# Altium schematic sheet CC_CV_Down-programmer.SchDoc
size A3; SheetNumber: 4; SheetTotal: 7
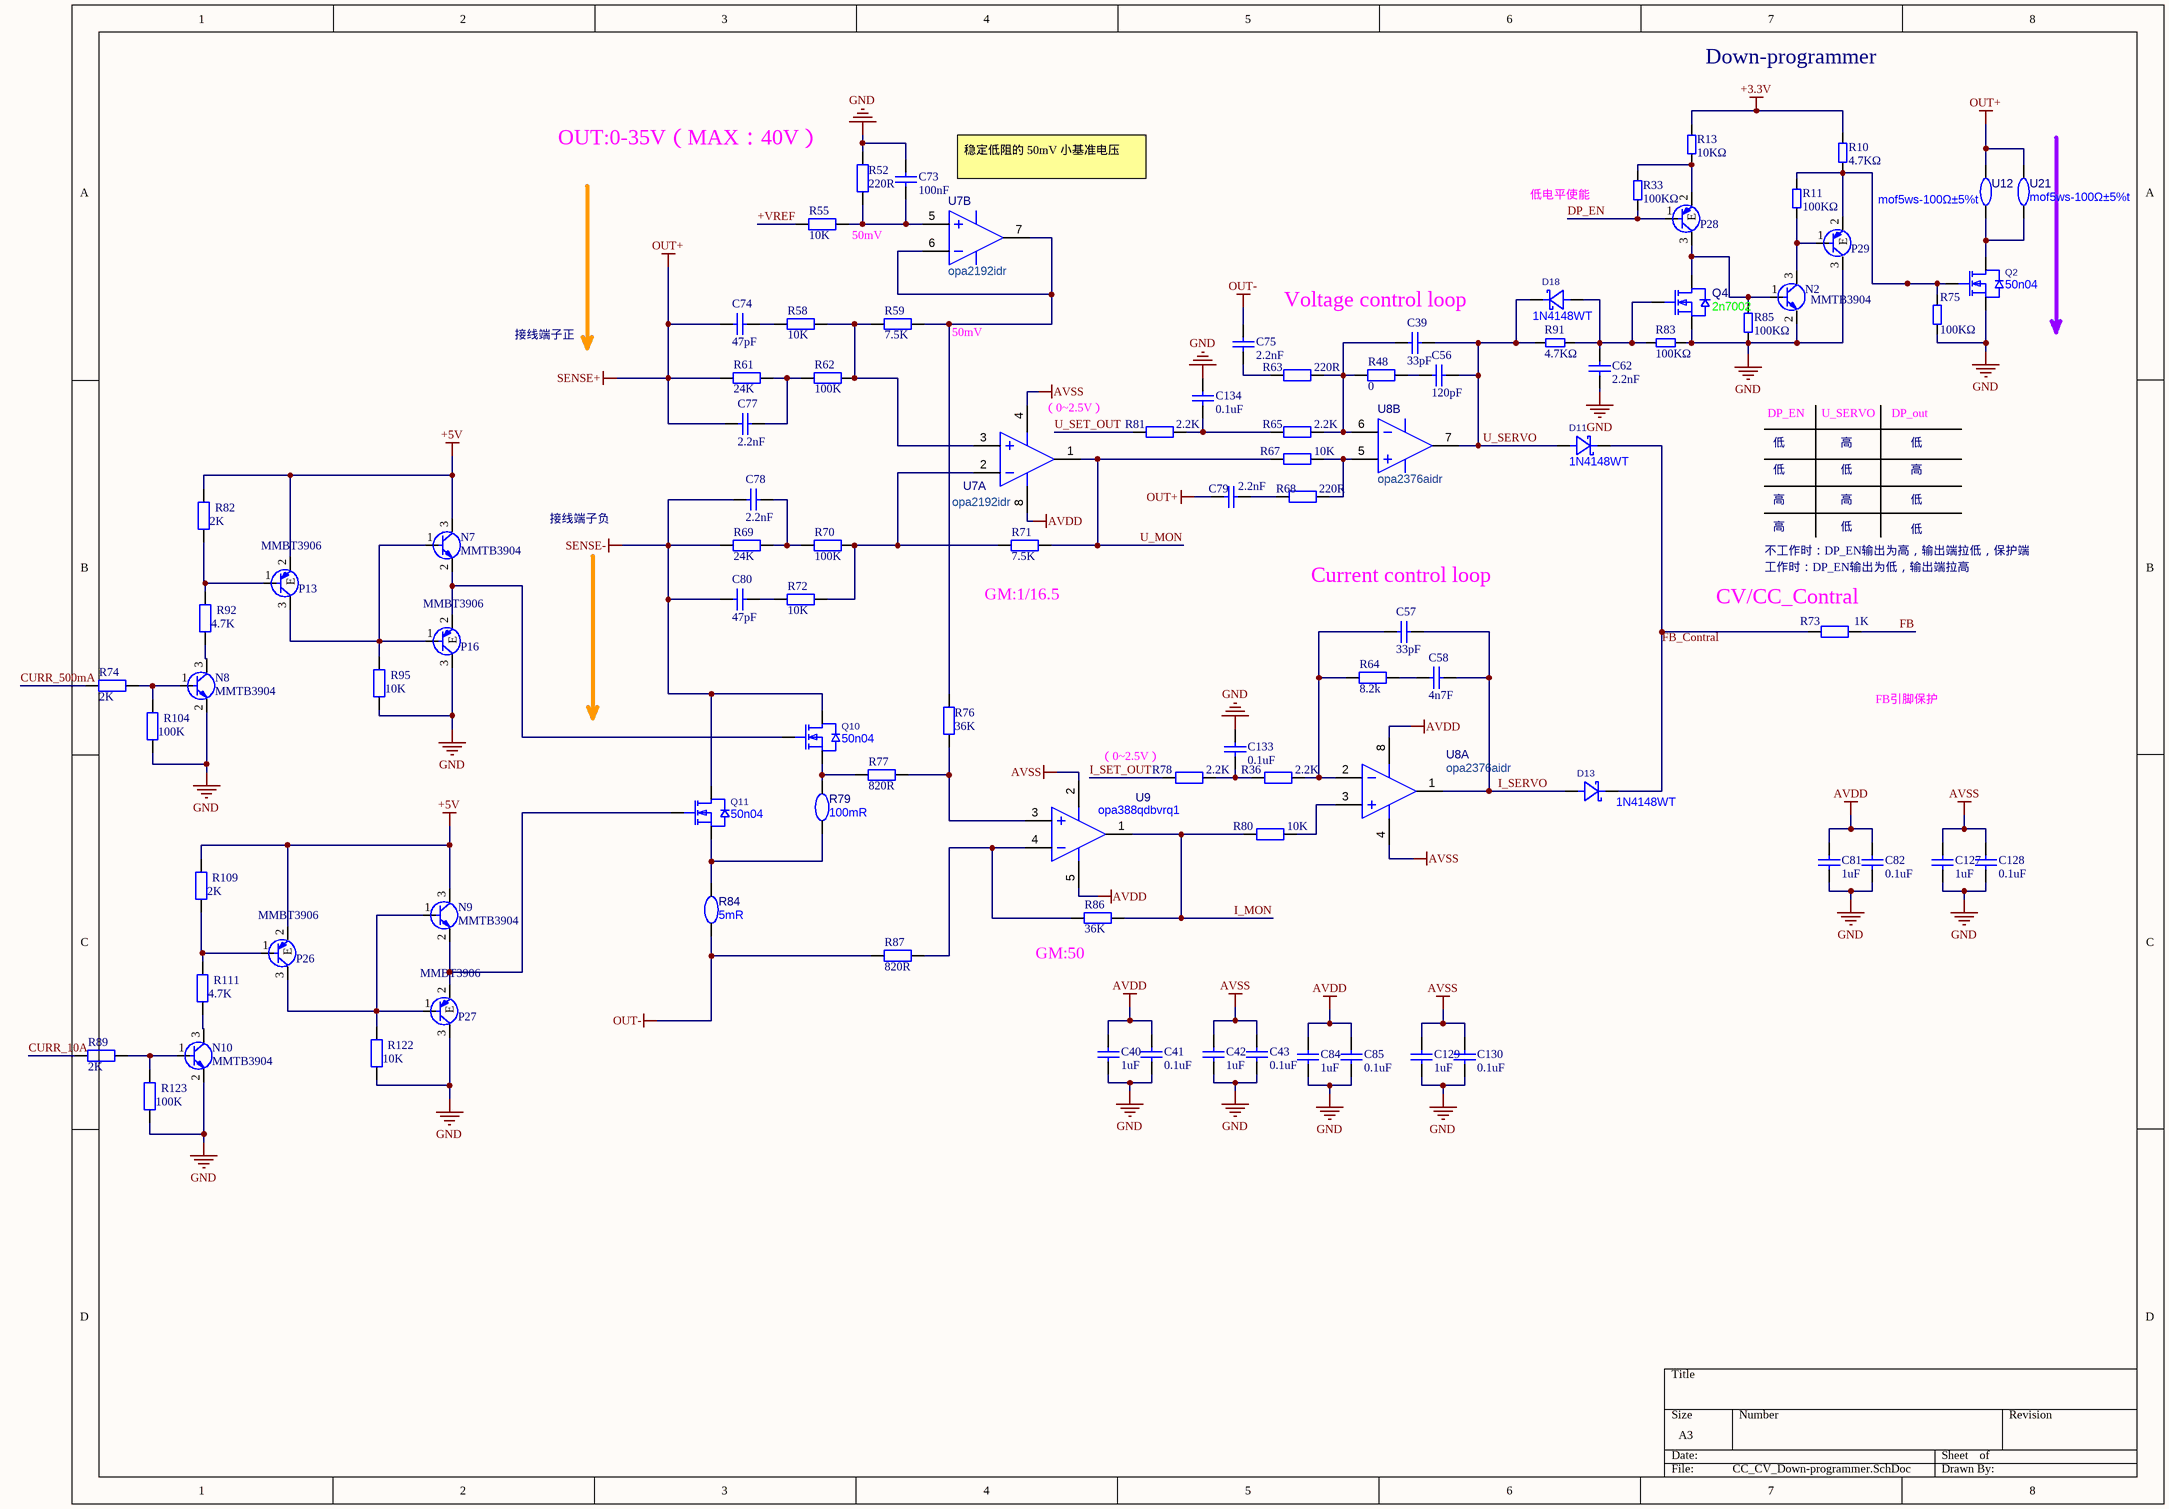
[diagram p0: CC_CV_Down-programmer.SchDoc]

## Parts
C39  33pF  [C0603]
C40  1uF  [C0603]
C41  0.1uF  [C0603]
C42  1uF  [C0603]
C43  0.1uF  [C0603]
C56  120pF  [C0603]
C57  33pF  [C0603]
C58  4n7F  [C0603]
C62  2.2nF  [C0603]
C73  100nF  [C0603]
C74  47pF  [C0603]
C75  2.2nF  [C0603]
C77  2.2nF  [C0603]
C78  2.2nF  [C0603]
C79  2.2nF  [C0603]
C80  47pF  [C0603]
C81  1uF  [C0603]
C82  0.1uF  [C0603]
C84  1uF  [C0603]
C85  0.1uF  [C0603]
C127  1uF  [C0603]
C128  0.1uF  [C0603]
C129  1uF  [C0603]
C130  0.1uF  [C0603]
C133  0.1uF  [C0603]
C134  0.1uF  [C0603]
D11  1N4148WT  [SOD-523_L1.2-W0.8-LS1.6-FD]
D13  1N4148WT  [SOD-523_L1.2-W0.8-LS1.6-FD]
D18  1N4148WT  [SOD-523_L1.2-W0.8-LS1.6-FD]
N2  MMTB3904  [SOT-23-3_L2.9-W1.3-P1.90-LS2.4-BR - duplicate]
N7  MMTB3904  [SOT-23-3_L2.9-W1.3-P1.90-LS2.4-BR - duplicate]
N8  MMTB3904  [SOT-23-3_L2.9-W1.3-P1.90-LS2.4-BR - duplicate]
N9  MMTB3904  [SOT-23-3_L2.9-W1.3-P1.90-LS2.4-BR - duplicate]
N10  MMTB3904  [SOT-23-3_L2.9-W1.3-P1.90-LS2.4-BR - duplicate]
P13  MMBT3906  [SOT-23-3_L2.9-W1.3-P1.90-LS2.4-BR]
P16  MMBT3906  [SOT-23-3_L2.9-W1.3-P1.90-LS2.4-BR]
P26  MMBT3906  [SOT-23-3_L2.9-W1.3-P1.90-LS2.4-BR]
P27  MMBT3906  [SOT-23-3_L2.9-W1.3-P1.90-LS2.4-BR]
P28  MMBT3906  [SOT-23-3_L2.9-W1.3-P1.90-LS2.4-BR]  (value not drawn)
P29  MMBT3906  [SOT-23-3_L2.9-W1.3-P1.90-LS2.4-BR]  (value not drawn)
Q2  50n04  [TO-252-2_L6.6-W6.1-P4.57-LS9.9-BR-CW]
Q4  2n7002  [SOT-23-3_L2.9-W1.3-P1.90-LS2.4-BR]
Q10  50n04  [TO-252-2_L6.6-W6.1-P4.57-LS9.9-BR-CW]
Q11  50n04  [TO-252-2_L6.6-W6.1-P4.57-LS9.9-BR-CW]
R10  4.7KΩ  [R0603]
R11  100KΩ  [R0603]
R13  10KΩ  [R0603]
R33  100KΩ  [R0603]
R36  2.2K  [R0603]
R48  0  [R0603]
R52  220R  [R0603]
R55  10K  [R0603]
R58  10K  [R0603]
R59  7.5K  [R0603]
R61  24K  [R0603]
R62  100K  [R0603]
R63  220R  [R0603]
R64  8.2k  [R0603]
R65  2.2K  [R0603]
R67  10K  [R0603]
R68  220R  [R0603]
R69  24K  [R0603]
R70  100K  [R0603]
R71  7.5K  [R0603]
R72  10K  [R0603]
R73  1K  [R0603]
R74  2K  [R0603]
R75  100KΩ  [R0603]
R76  36K  [R0603]
R77  820R  [R0603]
R78  2.2K  [R0603]
R79  100mR  [RES-SMD_L6.4-W3.2-1]
R80  10K  [R0603]
R81  2.2K  [R0603]
R82  2K  [R0603]
R83  100KΩ  [R0603]
R84  5mR  [RES-SMD_L6.4-W3.2-1]
R85  100KΩ  [R0603]
R86  36K  [R0603]
R87  820R  [R0603]
R89  2K  [R0603]
R91  4.7KΩ  [R0603]
R92  4.7K  [R0603]
R95  10K  [R0603]
R104  100K  [R0603]
R109  2K  [R0603]
R111  4.7K  [R0603]
R122  10K  [R0603]
R123  100K  [R0603]
U7  opa2192idr  [SOIC-8_L4.9-W3.9-P1.27-LS6.0-BL]  (parts A,B of 2)
U8  opa2376aidr  [SOIC-8_L4.9-W3.9-P1.27-LS6.0-BL]  (parts A,B of 2)
U9  opa388qdbvrq1  [SOT-23-5_L3.0-W1.7-P0.95-LS2.8-BR]
U12  mof5ws-100Ω±5%t  [RES-TH_BD6.0-L17.5-P21.50-D0.7]
U21  mof5ws-100Ω±5%t  [RES-TH_BD6.0-L17.5-P21.50-D0.7]

## Nets
+3.3V: R10.2 R13.2
+5V: N7.3 N9.3 P13.2(E) P26.2(E) R82.1 R109.1
AVDD: C40.2 C41.2 C81.2 C82.2 C84.2 C85.2 U7.8(VDD) U8.8(V+) U9.5(V+)
AVSS: C42.2 C43.2 C127.2 C128.2 C129.2 C130.2 U7.4(VSS) U8.4(V-) U9.2(V-)
GND: C40.1 C41.1 C42.1 C43.1 C62.2 C73.2 C81.1 C82.1 C84.1 C85.1 C127.1 C128.1 C129.1 C130.1 C133.2 C134.2 N2.2 N8.2 N10.2 P16.3(C) P27.3(C) P29.3(C) Q2.3(S) Q4.2(S) R52.1 R75.1 R83.2 R85.1 R95.2 R104.2 R122.2 R123.2
OUT+: C74.1 C77.1 C79.1 R61.2 U12.2 U21.2  [also labelled SENSE+]
OUT-: C75.1 R84.1 R87.2
SENSE-: C78.1 C80.1 Q10.2(D) Q11.2(D) R69.2
+VREF: R55.2
CURR_10A: R89.1
CURR_500mA: R74.1
DP_EN: P28.1(B) R33.1
FB: R73.1
FB_Contral: D11.2(K) D13.2(K) R73.2
I_MON: R80.2 R86.2 U9.1(OUTA)
I_SERVO: C57.2 C58.2 D13.1(A) U8.1(OUT_A)
I_SET_OUT: R78.2
U_MON: R67.2 R71.1 U7.1(VOUTA)
U_SERVO: C39.2 C56.2 D11.1(A) D18.2(K) R91.1 U8.7(OUT_B)
U_SET_OUT: R81.2
NetC39_1: C39.1 R48.2 R63.1 R65.1 U8.6(IN_B-)
NetC56_1: C56.1 R48.1
NetC57_1: C57.1 R36.1 R64.2 U8.2(IN_A-)
NetC58_1: C58.1 R64.1
NetC62_1: C62.1 D18.1(A) Q4.1(G) R83.1 R91.2
NetC73_1: C73.1 R52.2 R55.1 U7.5(VINB+)
NetC74_2: C74.2 R58.2
NetC75_2: C75.2 R63.2
NetC77_2: C77.2 R61.1 R62.2
NetC78_2: C78.2 R69.1 R70.2
NetC79_2: C79.2 R68.2
NetC80_2: C80.2 R72.2
NetC133_1: C133.1 R36.2 R78.1
NetC134_1: C134.1 R65.2 R81.1
NetN2_1: N2.1 P28.3(C) Q4.3(D) R85.2
NetN2_3: N2.3 P29.1(B) R11.1
NetN7_1: N7.1 P13.3(C) P16.1(B) R95.1
NetN7_2: N7.2 P16.2(E) Q10.1(G)
NetN8_1: N8.1 R74.2 R104.1
NetN8_3: N8.3 R92.2
NetN9_1: N9.1 P26.3(C) P27.1(B) R122.1
NetN9_2: N9.2 P27.2(E) Q11.1(G)
NetN10_1: N10.1 R89.2 R123.1
NetN10_3: N10.3 R111.2
NetP13_1: P13.1(B) R82.2 R92.1
NetP26_1: P26.1(B) R109.2 R111.1
NetP28_2: P28.2(E) R13.1 R33.2
NetP29_2: P29.2(E) Q2.1(G) R10.1 R11.2 R75.2
NetQ2_2: Q2.2(D) U12.1 U21.1
NetQ10_3: Q10.3(S) R77.2 R79.2
NetQ11_3: Q11.3(S) R79.1 R84.2
NetR58_1: R58.1 R59.2 R62.1 U7.3(VINA+)
NetR59_1: R59.1 R76.1 U7.6(VINB-) U7.7(VOUTB)
NetR67_1: R67.1 R68.1 U8.5(IN_B+)
NetR70_1: R70.1 R71.2 R72.1 U7.2(VINA-)
NetR76_2: R76.2 R77.1 U9.3(+INA)
NetR80_1: R80.1 U8.3(IN_A+)
NetR86_1: R86.1 R87.1 U9.4(-INA)

## Notes on the sheet
- Down-programmer
- OUT:0-35V（MAX：40V）
- 稳定低阻的 50mV 小基准电压
- (near R55) 50mV
- 低电平使能
- Voltage control loop
- 接线端子正
- (near R59) 50mV
- (near U7) （0~2.5V）
- DP_EN
- 低
- U_SERVO
- 高
- DP_out
- 接线端子负
- Current control loop
- 不工作时：DP_EN输出为高，输出端拉低，保护端
- 工作时：DP_EN输出为低，输出端拉高
- (near R71) GM:1/16.5
- (near R73) CV/CC_Contral
- FB引脚保护
- （0~2.5V）
- (near R86) GM:50

## Library data of the parts
C39-C43 C56-C58 C62 C73-C75 C77-C82 C84 C85 C127-C130 C133 C134 = C0603: Capacitor; Value: 104; Published: 8-Jun-2000; LatestRevisionDate: 17-Jul-2002; LatestRevisionNote: Re-released for DXP Platform.; Publisher: Altium Limited
D11 D13 D18 = 1N4148WT: 二极管配置:独立式;整流电流:150mA;直流反向耐压(Vr):100V;正向压降(Vf):1.25V@150mA;反向恢复时间(Trr):4ns;; Manufacturer: R+O(宏嘉诚); Symbol: 1N4148WT_C7420320; AddInBom: yes; ModelId: 8f56a03db567494d8f4c9d12aa52a741; ModelName: SOD-523_L1.2-W0.8-H0.7-LS1.6; ModelTransform: 62.992,31.496,0,0,0,0,0,0,0; Diode Configuration: 独立式; Pd - Power Dissipation: 150mW; Current - Rectified: 150mA; Voltage - DC Reverse(Vr): 100V; Non-Repetitive Peak Forward Surge Current: 2A; Reverse Leakage Current (Ir): 1uA@75V; Reverse Recovery Time (trr): 4ns; Operating Junction Temperature Range: -55℃~+150℃; LCSC Part Name: 100V 150mA; SupplierPart: C7420320; ManufacturerPart: 1N4148WT; Supplier Footprint: SOD-523; JLCPCB Part Class: Extended Part; Datasheet: https://item.szlcsc.com/datasheet/1N4148WT/8397142.html; Supplier: LCSC; ConvertToPcb: yes; FootprintName: SOD-523_L1.2-W0.8-LS1.6-FD; Voltage - Forward(Vf@If): 1.25V@150mA
Q2 Q10 Q11 = 50n04: 数量:1个N沟道;漏源电压(Vdss):40V;连续漏极电流(Id):45A;导通电阻(RDS(on)):11mΩ;耗散功率(Pd):20W;阈值电压(Vgs(th)):2V;; Manufacturer: HL(富海微); AddInBom: yes; ModelId: ce57f84d66384067af8a68020b6de06d; ModelName: TO-252-2L-3P_L6.6-W6.1-H2.3-LS10.1-P4.6; ModelTransform: 259.842,390.52442,0,90,0,0,-39.39,0,0; Number: 1个N沟道; Drain to Source Voltage: 40V; Current - Continuous Drain(Id): 45A; RDS(on): 11mΩ; Pd - Power Dissipation: 20W; Gate Threshold Voltage (Vgs(th)): 2V; Gate Charge(Qg): 22.9nC@10V; Type: N沟道; Symbol: 50N04; LCSC Part Name: 1个N沟道 耐压:40V 电流:45A; SupplierPart: C7543827; ManufacturerPart: 50N04; Supplier Footprint: TO-252; JLCPCB Part Class: Extended Part; Datasheet: https://item.szlcsc.com/datasheet/50N04/8649544.html; Supplier: LCSC; ConvertToPcb: yes; FootprintName: TO-252-2_L6.6-W6.1-P4.57-LS9.9-BR-CW; Operating Temperature: -55℃~+150℃
Q4 = 2n7002_c7420321: 数量:1个N沟道;漏源电压(Vdss):60V;连续漏极电流(Id):115mA;导通电阻(RDS(on)):900mΩ@10V;耗散功率(Pd):225mW;阈值电压(Vgs(th)):1.6V;; Manufacturer: R+O(宏嘉诚); AddInBom: yes; ModelId: c62791f0466c4ae2a892c056b845b0ca; ModelName: SOT-23-3P_L2.9-W1.3-H1.0-LS2.4-P0.95; ModelTransform: 98.425,114.173,0,180,0,0,0.0005,-0.0005,0; Number: 1个N沟道; Drain to Source Voltage: 60V; Current - Continuous Drain(Id): 115mA; Pd - Power Dissipation: 225mW; Gate Threshold Voltage (Vgs(th)): 1.6V; Gate Charge(Qg): 1.6nC@10V; Input Capacitance(Ciss): 50pF; Reverse Transfer Capacitance (Crss@Vds): 5pF; Type: N沟道; Output Capacitance(Coss): 25pF; Symbol: 2N7002_C7420321; LCSC Part Name: N沟道,电流:115mA,耐压:60V; SupplierPart: C7420321; ManufacturerPart: 2N7002; Supplier Footprint: SOT-23; JLCPCB Part Class: Extended Part; Datasheet: https://item.szlcsc.com/datasheet/2N7002/8397143.html; Supplier: LCSC; ConvertToPcb: yes; FootprintName: SOT-23-3_L2.9-W1.3-P1.90-LS2.4-BR; RDS(on): 900mΩ@10V; Operating Temperature: -55℃~+150℃
R10 R11 R13 R33 R75 R83 R85 R91 = 0603-1KΩ-5%: 片式电阻; 物料描述: 片式电阻器-0805-10KΩ-5%-JT; 物料号: NA
R36 R48 R52 R55 R58 R59 R61-R65 R67-R74 R76-R78 R80-R82 R86 R87 R89 R92 R95 R104 R109 R111 R122 R123 = R0603: Resistor; Published: 8-Jun-2000; LatestRevisionDate: 17-Jul-2002; LatestRevisionNote: Re-released for DXP Platform.; Publisher: Altium Limited
R79 R84 = hollr2512-3w-2mr-1%: 电阻类型:采样电阻;阻值:2mΩ;精度:±1%;额定压降:-;功率:3W;温度系数:±50ppm/℃;安装方式:贴片;; Manufacturer: Milliohm(毫欧); AddInBom: yes; ModelId: 2a92684014bd46c593e4aa7ce823c350; ModelTransform: 251.968,125.984,0,0,0,0,0,0,0; Value: 2mΩ; Tolerance: ±1%; Power(Watts): 3W; Rated Current: 77.5A; Mounting Sytle: 贴片; Symbol: HOLLR2512-3W-2MR-1%; LCSC Part Name: 2mΩ ±1% 3W; SupplierPart: C2994640; ManufacturerPart: HoLLR2512-3W-2mR-1%; Supplier Footprint: 2512; JLCPCB Part Class: Extended Part; Datasheet: https://atta.szlcsc.com/upload/public/pdf/source/20220330/9E8D3880B1628B3B70C68092C8A7E08B.pdf; Supplier: LCSC; ConvertToPcb: yes; FootprintName: RES-SMD_L6.4-W3.2-1; ModelName: RES-SMD_L6.4-W3.2-1; Type: 采样电阻; Rated Output Voltage: -; Temperature Coefficient: ±50ppm/℃
U7 = opa2192idr: 放大器数:双路;增益带宽积(GBP):10MHz;输入偏置电流(Ib):5pA;输入失调电压(Vos):-;压摆率(SR):20V/us;轨到轨:轨到轨输入,轨到轨输出;; Manufacturer: TI(德州仪器); AddInBom: yes; ModelId: e81d2f7d937b4a6ab1dca543ff5d56a4; ModelName: SOIC-8_L4.9-W3.9-H1.7-LS6.0-P1.27; ModelTransform: 192.913,236.22,0,0,0,0,0,0,0; Number of Channels: 双路; Gain Bandwidth Product: 10MHz; Ib - Input Bias Current: 5pA; Slew Rate: 20V/us; Output Current: 65mA; Quiescent Current(Iq): 1mA; Symbol: OPA2192IDR; LCSC Part Name: OPA2192IDR; SupplierPart: C110074; ManufacturerPart: OPA2192IDR; Supplier Footprint: SOIC-8; JLCPCB Part Class: Extended Part; Datasheet: https://www.ti.com/cn/lit/gpn/opa2192; Supplier: LCSC; ConvertToPcb: yes; FootprintName: SOIC-8_L4.9-W3.9-P1.27-LS6.0-BL; Vos - Input Offset Voltage: -; Common Mode Rejection Ratio(CMRR): -; Rail to Rail: 轨到轨输入,轨到轨输出; Operating Temperature: -40℃~+125℃
U8 = opa2376aidr_1: 放大器数:双路;增益带宽积(GBP):5.5MHz;输入偏置电流(Ib):0.2pA;压摆率(SR):2V/us;轨到轨:-;; Manufacturer: TI(德州仪器); AddInBom: yes; ModelId: e81d2f7d937b4a6ab1dca543ff5d56a4; ModelName: SOIC-8_L4.9-W3.9-H1.7-LS6.0-P1.27; ModelTransform: 192.913,236.22,0,0,0,0,0,0,0; Number of Circuits: 双路; Gain Bandwidth Product(GBP): 5.5MHz; Current - Input Bias(Ib): 0.2pA; Slew Rate(SR): 2V/us; Output Current: 50mA; Supply Current: 760uA; Symbol: OPA2376AID; LCSC Part Name: OPA2376AIDR; SupplierPart: C46316; ManufacturerPart: OPA2376AIDR; Supplier Footprint: SOIC-8; JLCPCB Part Class: Extended Part; Datasheet: https://www.ti.com/cn/lit/gpn/opa376; Supplier: LCSC; ConvertToPcb: yes; FootprintName: SOIC-8_L4.9-W3.9-P1.27-LS6.0-BL; Output Type: -; Rail to Rail: -; Operating Temperature: -40℃~+125℃
U9 = opa388qdbvrq1: 放大器数:单路;增益带宽积(GBP):10MHz;输入偏置电流(Ib):30pA;输入失调电压(Vos):250nV;压摆率(SR):5V/us;轨到轨:轨到轨输入,轨到轨输出;; Manufacturer: TI(德州仪器); AddInBom: yes; ModelId: 0a2a1b8f50944f73965918ad6e5fe167; ModelName: SOT-23-5_L2.9-W1.6-H1.1-LS2.8-P0.95; ModelTransform: 114.173,109.636,0,180,0,0,0,0,0; Number of Channels: 单路; Gain Bandwidth Product: 10MHz; Ib - Input Bias Current: 30pA; Vos - Input Offset Voltage: 250nV; Common Mode Rejection Ratio(CMRR): 140dB; Slew Rate: 5V/us; Output Current: 60mA; Input Offset Voltage Drift(Vos TC): 5nV/℃; Quiescent Current(Iq): 1.9mA; Single Supply: 2.5V~5.5V; Dual Supply: 1.25V~2.75V；-2.75V~-1.25V; Maximum Power Supply Range (Vdd-Vss): 5.5V; Noise density(eN): 7nV/√Hz@1kHz; Input Offset Current(Ios): 700pA; Symbol: OPA388QDBVRQ1; LCSC Part Name: 自动、精密、零漂移、零交叉、真正的轨至轨输入/输出运算放大器; SupplierPart: C2871496; ManufacturerPart: OPA388QDBVRQ1; Supplier Footprint: SOT-23-5; JLCPCB Part Class: Extended Part; Datasheet: https://www.ti.com/cn/lit/gpn/opa388-q1; Supplier: LCSC; ConvertToPcb: yes; FootprintName: SOT-23-5_L3.0-W1.7-P0.95-LS2.8-BR; Rail to Rail: 轨到轨输入,轨到轨输出; Features: EMI滤波/RF抑制；零漂移/自动稳零；过压保护; Operating Temperature: -40℃~+125℃
U12 U21 = mof5ws-100Ω±5%t: 电阻类型:金属氧化膜电阻;阻值:100Ω;精度:±5%;功率:5W;温度系数:±700ppm/℃;; Manufacturer: 华星机电; AddInBom: yes; ModelId: a7638b0f76d54b0db5a676fc97b6c5ec; ModelTransform: 873.2266,236.22,0,0,0,0,-0.005,0,-196.85; Value: 100Ω; Tolerance: ±5%; Power(Watts): 5W; Symbol: MOF5WS-100Ω±5%T; LCSC Part Name: 金属氧化膜电阻 100Ω ±5% 5W; SupplierPart: C714488; ManufacturerPart: MOF5WS-100Ω±5%T; Supplier Footprint: 插件,D6xL17.5mm; JLCPCB Part Class: Extended Part; Datasheet: https://item.szlcsc.com/datasheet/MOF5WS-100%25CE%25A9%25C2%25B15%2525T/754813.html; Supplier: LCSC; ConvertToPcb: yes; FootprintName: RES-TH_BD6.0-L17.5-P21.50-D0.7; ModelName: RES-TH_BD6.0-L17.5-P21.50-D0.7; Type: 金属氧化膜电阻; Temperature Coefficient: ±700ppm/℃
N2 N7-N10 = MMTB3904: Part Number: *; Brand: *
P13 P16 P26-P29 = MMBT3906: Part Number: *; Brand: *